# Altium schematic sheet Whisper_Debugger.SchDoc
size A4; SheetNumber: 1; SheetTotal: 4
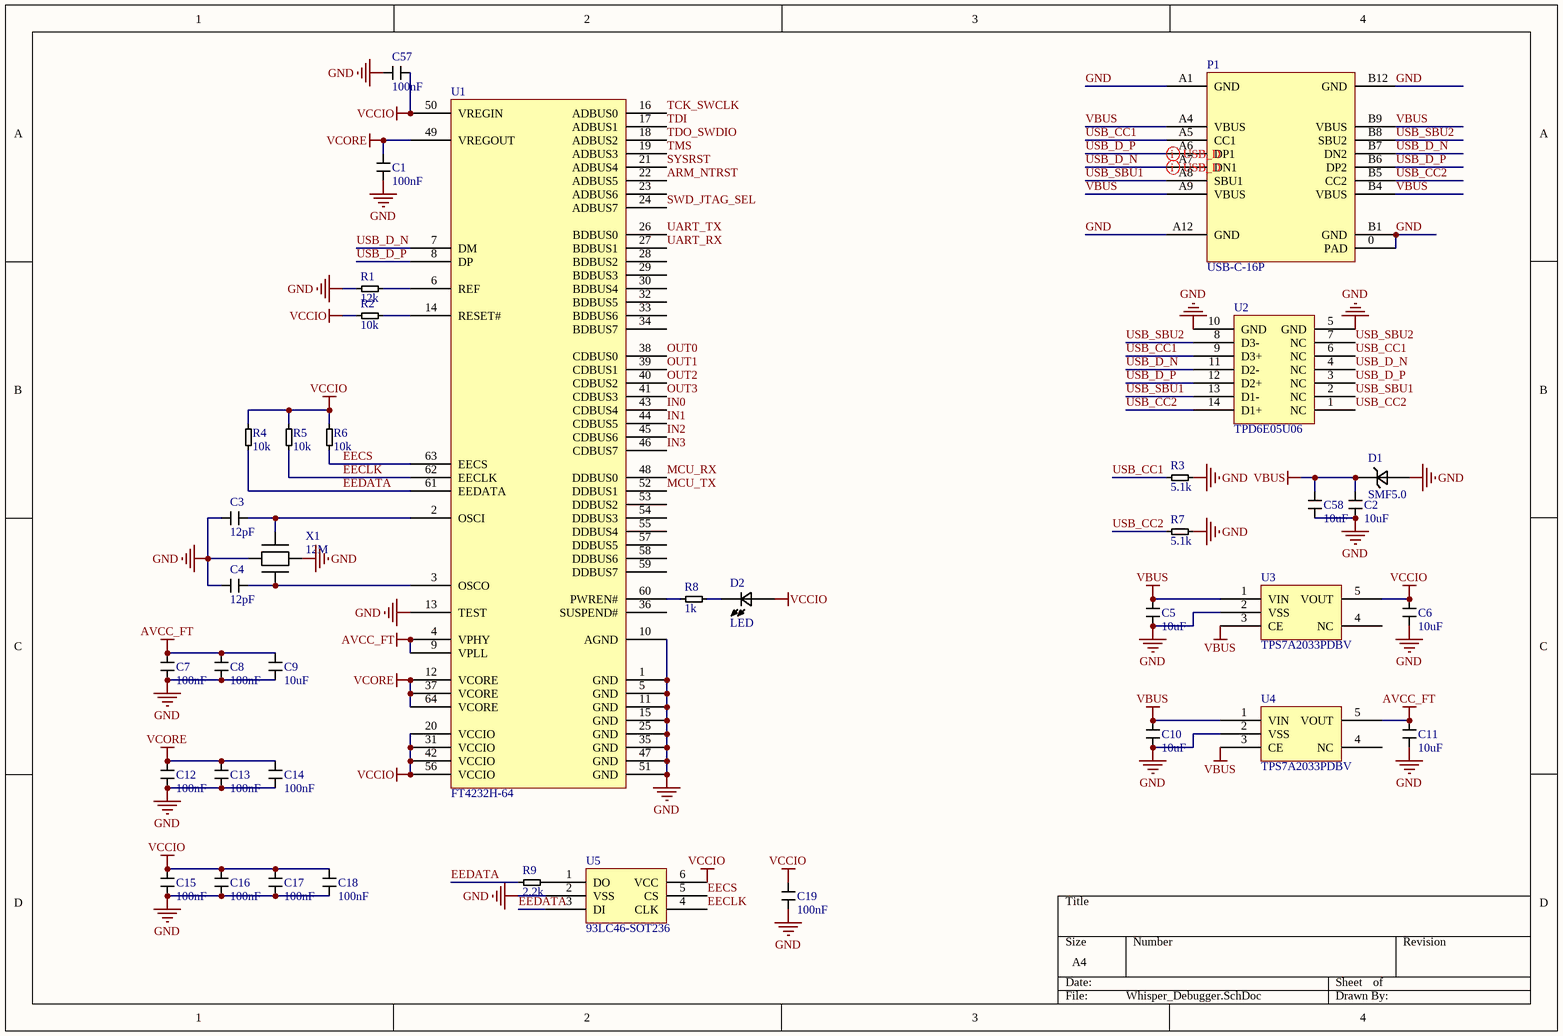
[diagram p0: Whisper_Debugger.SchDoc]

## Parts
C1  100nF  [0603-Cap]
C2  10uF  [0603-Cap]
C3  12pF  [0603-Cap]
C4  12pF  [0603-Cap]
C5  10uF  [0603-Cap]
C6  10uF  [0603-Cap]
C7  100nF  [0603-Cap]
C8  100nF  [0603-Cap]
C9  10uF  [0603-Cap]
C10  10uF  [0603-Cap]
C11  10uF  [0603-Cap]
C12  100nF  [0603-Cap]
C13  100nF  [0603-Cap]
C14  100nF  [0603-Cap]
C15  100nF  [0603-Cap]
C16  100nF  [0603-Cap]
C17  100nF  [0603-Cap]
C18  100nF  [0603-Cap]
C19  100nF  [0603-Cap]
C57  100nF  [0603-Cap]
C58  10uF  [0603-Cap]
D1  SMF5.0  [SOD-123]
D2  LED  [0603-1]
P1  USB-C-16P  [USB-C-16P]
R1  12k  [0603]
R2  10k  [0603]
R3  5.1k  [0603]
R4  10k  [0603]
R5  10k  [0603]
R6  10k  [0603]
R7  5.1k  [0603]
R8  1k  [0603]
R9  2.2k  [0603]
U1  FT4232H-64  [LQFP-64]
U2  TPD6E05U06  [SON-14-RVZ]
U3  TPS7A2033PDBV  [SOT23-5]
U4  TPS7A2033PDBV  [SOT23-5]
U5  93LC46-SOT236  [SOT236]
X1  12M  [XTAL-3225-4P]

## Nets
AVCC_FT: C7.2 C8.2 C9.2 C11.2 U1.4(VPHY) U1.9(VPLL) U4.5(VOUT)
GND: C1.1 C2.1 C3.2 C4.2 C5.1 C6.1 C7.1 C8.1 C9.1 C10.1 C11.1 C12.1 C13.1 C14.1 C15.1 C16.1 C17.1 C18.1 C19.1 C57.2 C58.1 D1.1 P1.0(PAD) P1.A1(GND) P1.A12(GND) P1.B1(GND) P1.B12(GND) R1.2 R3.1 R7.1 U1.1(GND) U1.5(GND) U1.10(AGND) U1.11(GND) U1.13(TEST) U1.15(GND) U1.25(GND) U1.35(GND) U1.47(GND) U1.51(GND) U2.5(GND) U2.10(GND) U3.2(VSS) U4.2(VSS) U5.2(VSS) X1.2 X1.4
VBUS: C2.2 C5.2 C10.2 C58.2 D1.2 P1.A4(VBUS) P1.A9(VBUS) P1.B4(VBUS) P1.B9(VBUS) U3.1(VIN) U3.3(CE) U4.1(VIN) U4.3(CE)
VCCIO: C6.2 C15.2 C16.2 C17.2 C18.2 C19.2 C57.1 D2.1 R2.2 R4.1 R5.1 R6.1 U1.20(VCCIO) U1.31(VCCIO) U1.42(VCCIO) U1.50(VREGIN) U1.56(VCCIO) U3.5(VOUT) U5.6(VCC)
VCORE: C1.2 C12.2 C13.2 C14.2 U1.12(VCORE) U1.37(VCORE) U1.49(VREGOUT) U1.64(VCORE)
ARM_NTRST: U1.22(ADBUS5)
EECLK: R5.2 U1.62(EECLK) U5.4(CLK)
EECS: R6.2 U1.63(EECS) U5.5(CS)
EEDATA: R4.2 R9.2 U1.61(EEDATA) U5.3(DI)
IN0: U1.43(CDBUS4)
IN1: U1.44(CDBUS5)
IN2: U1.45(CDBUS6)
IN3: U1.46(CDBUS7)
MCU_RX: U1.48(DDBUS0)
MCU_TX: U1.52(DDBUS1)
OUT0: U1.38(CDBUS0)
OUT1: U1.39(CDBUS1)
OUT2: U1.40(CDBUS2)
OUT3: U1.41(CDBUS3)
SWD_JTAG_SEL: U1.24(ADBUS7)
SYSRST: U1.21(ADBUS4)
TCK_SWCLK: U1.16(ADBUS0)
TDI: U1.17(ADBUS1)
TDO_SWDIO: U1.18(ADBUS2)
TMS: U1.19(ADBUS3)
UART_RX: U1.27(BDBUS1)
UART_TX: U1.26(BDBUS0)
USB_CC1: P1.A5(CC1) R3.2 U2.6(NC) U2.9(D3+)
USB_CC2: P1.B5(CC2) R7.2 U2.1(NC) U2.14(D1+)
USB_D_N: P1.A7(DN1) P1.B7(DN2) U1.7(DM) U2.4(NC) U2.11(D2-)
USB_D_P: P1.A6(DP1) P1.B6(DP2) U1.8(DP) U2.3(NC) U2.12(D2+)
USB_SBU1: P1.A8(SBU1) U2.2(NC) U2.13(D1-)
USB_SBU2: P1.B8(SBU2) U2.7(NC) U2.8(D3-)
NetC3_1: C3.1 U1.2(OSCI) X1.3
NetC4_1: C4.1 U1.3(OSCO) X1.1
NetD2_2: D2.2 R8.1
NetR1_1: R1.1 U1.6(REF)
NetR2_1: R2.1 U1.14(RESET#)
NetR8_2: R8.2 U1.60(PWREN#)
NetR9_1: R9.1 U5.1(DO)

Not connected (* = marked no-connect by the designer): U1 23(ADBUS6) 28(BDBUS2) 29(BDBUS3) 30(BDBUS4) 32(BDBUS5) 33(BDBUS6) 34(BDBUS7) 36(SUSPEND#) 53(DDBUS2) 54(DDBUS3) 55(DDBUS4) 57(DDBUS5) 58(DDBUS6) 59(DDBUS7); U3 4(NC); U4 4(NC)

## Layout directives
differential pair: USB_D_N, USB_D_P

## Library data of the parts
C1-C4 C7-C9 C12-C19 C57 C58 = Cap
C5 C6 C10 C11 = Cap: CL10A475KA8NQNC
D1 = TVS
P1 = USB-C-16P: TYPE-C 16PIN 2MD(073)
R1-R9 = Res
U2 = TPD6E
U3 U4 = ME6211
X1 = XTAL-4LEAD